# EasyEDA Pro project travellium-12v-desktop-power-supply-cc8d8467.epro, board MK9218_PCB
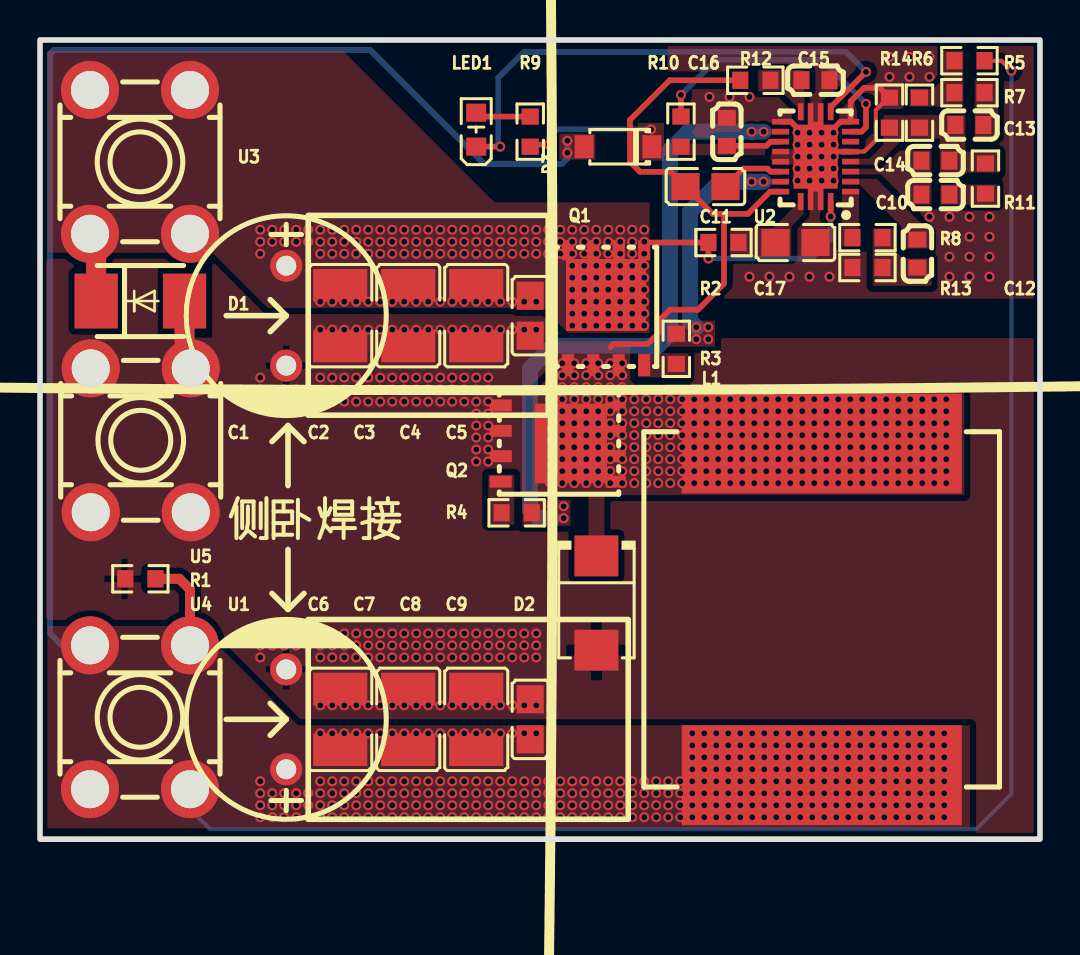
[diagram p9: board, top side]
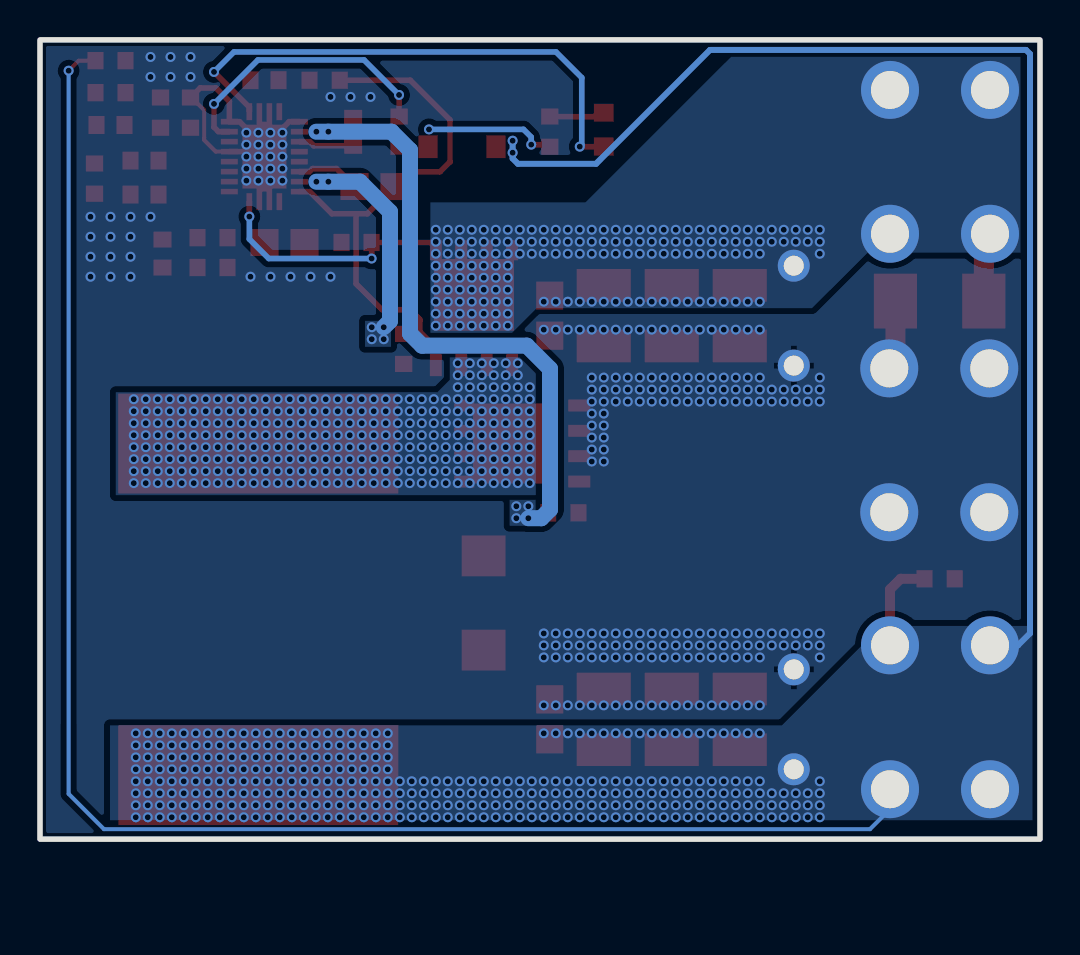
[diagram p10: board, bottom side, seen from below]

Outline 50 x 40 mm; copper layers: Top Layer, Bottom Layer. Coordinates in mm from the lower left corner of the outline.
Outline path: rectangle 50,0 0,40
Stack: Top Layer 0.035mm / Dielectric1 1.51mm FR4 er 4.5 / Bottom Layer 0.035mm

## Design rules (mm)
spacing copperThickness1oz (default): track to track 0.102, other pairs 0.152 to 0.3
spacing copperThickness2oz: track to track 0.203, other pairs 0.152 to 0.3
spacing Plane_innerPlane: track to track 0.102, other pairs 0.152 to 0.3
spacing Copper_copperRegion: track to track 0.102, other pairs 0.152 to 0.3
track width copperThickness1oz: min 0.127, default 0.254, max 2.54
track width copperThickness2oz: min 0.203, default 0.254, max 2.54
track width Travellium (default): min 0.099, default 0.201, max 10
differential pair differentialPair (default): width min 0.127, default 0.254, max 2.54; gap min 0.152, default 0.152
pour e1197 uses Copper_copperRegion
pour e1202 uses Copper_copperRegion
pour e1204 uses Copper_copperRegion
pour e1206 uses Copper_copperRegion

## Placement (name value [footprint] x y rotation side)
C1  100uF  [CAP-TH_BD10.0-P5.00-D0.6-FD_2]  12.31 26.2 270 top
C2  4.7uF  [C1210]  15.01 26.2 90 top
C3  4.7uF  [C1210]  18.41 26.2 90 top
C4  4.7uF  [C1210]  21.81 26.2 90 top
C5  100nF  [C0805]  24.51 26.2 90 top
C6  47uF  [C1210]  15.01 6 270 top
C7  47uF  [C1210]  18.41 6 270 top
C8  47uF  [C1210]  21.81 6 270 top
C9  100nF  [C0805]  24.51 6 270 top
C10  750pF  [C0603]  44.77 32.26 180 top
C11  100nF  [C0805]  33.27 32.66 0 top
C12  47nF  [C0603]  43.87 29.31 270 top
C13  390nF  [C0603]  46.47 35.74 180 top
C14  8.5pF  [C0603]  44.77 33.96 180 top
C15  10pF  [C0603]  38.77 37.99 180 top
C16  2.2uF  [C0603]  34.34 35.4 270 top
C17  100nF  [C0805]  37.77 29.86 0 top
D1  SMBJ64A  [SMB_L4.4-W3.6-LS5.3-L-FD]  5.02 26.93 180 top
D2  SMBJ15A  [SMB_L4.6-W3.6-LS5.3-RD]  27.82 11.82 270 top
D3  1N4148W  [SOD-123_L2.8-W1.8-LS3.7-RD]  28.9 34.66 180 top
L1  1.5uH  [IND-SMD_L17.5-W17.5]  39.08 11.5 270 top
LED1  NCD0603G1  [LED0603-RD_1]  21.81 35.51 90 top
Q1  BSC040N10NS5  [PG-TDSON-8_L5.9-W5.1-P1.27-LS6.1-BL]  28.3 26.6 0 top
Q2  BSC040N10NS5  [PG-TDSON-8_L5.9-W5.1-P1.27-LS6.1-BL]  25.91 19.8 270 top
R1  12kΩ  [R0603]  5.02 13.03 0 top
R2  2.2Ω  [R0603]  34.17 29.86 180 top
R3  0Ω  [R0603]  31.82 24.54 90 top
R4  0Ω  [R0603]  23.83 16.33 0 top
R5  51Ω  [R0603]  46.47 38.96 0 top
R6  51kΩ  [R0603]  43.97 36.36 90 top
R7  13kΩ  [R0603]  46.47 37.36 180 top
R8  12kΩ  [R0603]  41.37 30.1 180 top
R9  20kΩ  [R0603]  24.51 35.41 270 top
R10  20kΩ  [R0603]  32.05 35.41 270 top
R11  44.2kΩ  [R0603]  47.27 33.06 270 top
R12  390Ω  [R0603]  35.77 37.98 0 top
R13  0Ω  [R0603]  41.37 28.61 0 top
R14  3.6kΩ  [R0603]  42.47 36.36 270 top
U1  470uF  [CAP-TH_BD10.0-P5.00-D0.6-FD]  12.31 6 90 top
U2  MK9218  [VQFN-20_L4.5-W3.5-P0.50-BL-EP_TI_RHL0020A]  38.78 34.16 90 top
U3  T44001  [CONN-TH_T44001]  5 33.9 180 top
U4  T44001  [CONN-TH_T44001]  5 6.1 180 top
U5  T44001  [CONN-TH_T44001]  5.04 19.96 0 top

## Footprints (pads in the part's own frame, mm; a bottom-side part is the same pattern mirrored in y, then rotated)
C0603
  rect 0.8x0.9 smd: 1(-0.7,0) 2(0.7,0)
C0805
  rect 1.41x1.35 smd: 1(-1,0) 2(1,0)
C1210
  rect 1.635x2.7 smd: 1(-1.518,0) 2(1.518,0)
CAP-TH_BD10.0-P5.00-D0.6-FD
  round 1.6 hole 1: 1(-2.5,0) 2(2.5,0)
CAP-TH_BD10.0-P5.00-D0.6-FD_2
  round 1.6 hole 1: 1(-2.5,0) 2(2.5,0)
CONN-TH_T44001
  round 2.9 hole 1.9: 1(-2.5,3.6) 2(-2.5,-3.6) 3(2.5,-3.6) 4(2.5,3.6)
IND-SMD_L17.5-W17.5
  rect 5x14 smd: 1(-8.3,0) 2(8.3,0)
LED0603-RD_1
  rect 0.9x1 smd: 1(-0.85,0) 2(0.85,0)
PG-TDSON-8_L5.9-W5.1-P1.27-LS6.1-BL
  rect 0.6x1.1 smd: 1(-1.905,-2.875) 2(-0.635,-2.875) 3(0.635,-2.875) 4(1.905,-2.875)
  rect 0.6x1 smd: 5(1.905,2.875) 6(0.635,2.875) 7(-0.635,2.875) 8(-1.905,2.875)
  rect 4x3.6 smd: 8(0,0.638)
R0603
  rect 0.806x0.864 smd: 1(-0.753,0) 2(0.753,0)
SMB_L4.4-W3.6-LS5.3-L-FD
  rect 2.159x2.743 smd: 1(-2.21,0) 2(2.21,0)
SMB_L4.6-W3.6-LS5.3-RD
  rect 2.047x2.192 smd: 1(-2.361,0) 2(2.361,0)
SOD-123_L2.8-W1.8-LS3.7-RD
  rect 0.95x1.15 smd: 1(-1.692,0) 2(1.692,0)
VQFN-20_L4.5-W3.5-P0.50-BL-EP_TI_RHL0020A
  rect 0.85x0.28 smd: 1(-2.25,-0.752) 10(2.25,-0.752) 20(-2.25,0.75)
  rect 0.28x0.85 smd: 2(-1.748,-1.75) 3(-1.248,-1.75) 4(-0.749,-1.75) 5(-0.248,-1.75) 6(0.252,-1.75) 7(0.751,-1.75) 8(1.252,-1.75) 9(1.752,-1.75) 12(1.752,1.75) 13(1.252,1.75) 14(0.75,1.748) 15(0.25,1.748) 16(-0.25,1.748) 17(-0.75,1.748) 18(-1.25,1.748) 19(-1.75,1.748)
  custom 0.85x0.28 smd: 11(2.25,0.748)
  custom 5.35x2.2 smd: 21(0,0)

## Nets
As in the schematic.

Pads without a net: U2 7

## Via types
v1: diameter 0.5, hole 0.3, Top Layer to Bottom Layer, 993 vias
v2: diameter 0.5, hole 0.299, Top Layer to Bottom Layer, 31 vias

## Routing (per net, layer and track width the routed paths; a pad name or vN(x,y) marks a point on that pad's centre or on a via; arc(x,y) is an arc through that point)
GND: length 14.8
  Top Layer w0.2: R14.1 42.41,37.11 41.79,36.49 41.79,35.1 41.8,35.09 41.8,35 41.21,34.41 U2.6
  Top Layer w0.28: v1(39.68,35.36) 39.68,35.57 40.02,35.91 U2.9 40.53,36.93 41.2,37.6 41.99,37.6 R14.1 ; U2.6 39.33,34.41 v1(39.08,34.16) ; v1(37.88,35.36) 37.88,35.57 37.54,35.91 U2.12
  Top Layer w1: D1.1 7.23,23.87 U5.4
  vias: v1(11.01,23.1) v1(11.01,22.5) v1(11.01,21.9) v1(11.01,10.3) v1(11.01,9.7) v1(11.01,9.1) v1(11.61,22.5) v1(11.61,21.9) v1(11.61,10.3) v1(11.61,9.7) v1(12.21,22.5) v1(12.21,21.9) v1(12.21,10.3) v1(12.21,9.7) v1(12.81,22.5) v1(12.81,21.9) v1(12.81,10.3) v1(12.81,9.7) v1(13.41,22.5) v1(13.41,21.9) v1(13.41,10.3) v1(13.41,9.7) v1(14.01,25.5) v1(14.01,23.1) v1(14.01,22.5) v1(14.01,21.9) v1(14.01,10.3) v1(14.01,9.7) v1(14.01,9.1) v1(14.01,6.7) v1(14.61,25.5) v1(14.61,23.1) v1(14.61,22.5) v1(14.61,21.9) v1(14.61,10.3) v1(14.61,9.7) v1(14.61,9.1) v1(14.61,6.7) v1(15.21,25.5) v1(15.21,23.1) v1(15.21,22.5) v1(15.21,21.9) v1(15.21,10.3) v1(15.21,9.7) v1(15.21,9.1) v1(15.21,6.7) v1(15.81,25.5) v1(15.81,23.1) v1(15.81,22.5) v1(15.81,21.9) v1(15.81,10.3) v1(15.81,9.7) v1(15.81,9.1) v1(15.81,6.7) v1(16.41,25.5) v1(16.41,23.1) v1(16.41,22.5) v1(16.41,21.9) v1(16.41,10.3) v1(16.41,9.7) v1(16.41,9.1) v1(16.41,6.7) v1(17.01,25.5) v1(17.01,23.1) v1(17.01,22.5) v1(17.01,21.9) v1(17.01,10.3) v1(17.01,9.7) v1(17.01,9.1) v1(17.01,6.7) v1(17.61,25.5) v1(17.61,23.1) v1(17.61,22.5) v1(17.61,21.9) v1(17.61,10.3) v1(17.61,9.7) v1(17.61,9.1) v1(17.61,6.7) v1(18.21,25.5) v1(18.21,23.1) v1(18.21,22.5) v1(18.21,21.9) v1(18.21,10.3) v1(18.21,9.7) v1(18.21,9.1) v1(18.21,6.7) v1(18.81,25.5) v1(18.81,23.1) v1(18.81,22.5) v1(18.81,21.9) v1(18.81,10.3) v1(18.81,9.7) v1(18.81,9.1) v1(18.81,6.7) v1(19.41,25.5) v1(19.41,23.1) v1(19.41,22.5) v1(19.41,21.9) v1(19.41,10.3) v1(19.41,9.7) v1(19.41,9.1) v1(19.41,6.7) v1(20.01,25.5) v1(20.01,23.1) v1(20.01,22.5) v1(20.01,21.9) v1(20.01,10.3) v1(20.01,9.7) v1(20.01,9.1) v1(20.01,6.7) v1(20.61,25.5) v1(20.61,23.1) v1(20.61,22.5) v1(20.61,21.9) v1(20.61,10.3) v1(20.61,9.7) v1(20.61,9.1) v1(20.61,6.7) v1(21.21,25.5) v1(21.21,23.1) v1(21.21,22.5) v1(21.21,21.9) v1(21.21,10.3) v1(21.21,9.7) v1(21.21,9.1) v1(21.21,6.7) v1(21.81,25.5) v1(21.81,23.1) v1(21.81,22.5) v1(21.81,21.9) v1(21.81,21.3) v1(21.81,20.7) v1(21.81,20.1) v1(21.81,19.5) v1(21.81,18.9) v1(21.81,10.3) v1(21.81,9.7) v1(21.81,9.1) v1(21.81,6.7) v1(22.41,25.5) v1(22.41,23.1) v1(22.41,22.5) v1(22.41,21.9) v1(22.41,21.3) v1(22.41,20.7) v1(22.41,20.1) v1(22.41,19.5) v1(22.41,18.9) v1(22.41,10.3) v1(22.41,9.7) v1(22.41,9.1) v1(22.41,6.7) v1(23.01,25.5) v1(23.01,10.3) v1(23.01,9.7) v1(23.01,9.1) v1(23.01,6.7) v1(23.61,25.5) v1(23.61,10.3) v1(23.61,9.7) v1(23.61,9.1) v1(23.61,6.7) v1(24.21,25.5) v1(24.21,10.3) v1(24.21,9.7) v1(24.21,9.1) v1(24.21,6.7) v1(24.81,25.5) v1(24.81,10.3) v1(24.81,9.7) v1(24.81,9.1) v1(24.81,6.7) v1(37.88,34.76) v1(37.88,34.16) v1(37.88,33.56) v1(37.88,32.96) v1(38.48,35.36) v1(38.48,34.76) v1(38.48,34.16) v1(38.48,33.56) v1(38.48,32.96) v1(39.08,35.36) v1(39.08,34.76) v1(39.08,33.56) v1(39.08,32.96) v1(39.68,34.76) v1(39.68,34.16) v1(39.68,33.56) v1(39.68,32.96) v2(33.47,37.15) v2(34.47,37.15) v2(35.47,37.15) v2(35.47,28.15) v2(36.47,28.15) v2(37.47,28.15) v2(38.47,28.15) v2(39.47,28.15) v2(42.47,39.15) v2(42.47,38.15) v2(43.47,39.15) v2(43.47,38.15) v2(44.47,39.15) v2(44.47,38.15) v2(44.47,31.15) v2(45.47,31.15) v2(45.47,30.15) v2(45.47,29.15) v2(45.47,28.15) v2(46.47,31.15) v2(46.47,30.15) v2(46.47,29.15) v2(46.47,28.15) v2(47.47,31.15) v2(47.47,30.15) v2(47.47,29.15) v2(47.47,28.15)
P12V: length 146
  Top Layer w0.2: v1(48.57,38.46) 48.07,38.96 47.23,38.96
  Top Layer w0.5: R1.2 6.97,13.03 7.5,12.5 U4.2
  Bottom Layer w0.2: 7,2 8.5,0.5 46.8,0.5 48.57,2.27 v1(48.57,38.46)
  Bottom Layer w0.3: U4.3 1.1,9.7 0.5,10.3 0.5,39.3 0.7,39.5 16.5,39.5 22.2,33.8 26.1,33.8 26.37,34.07 v1(26.37,34.36) v1(26.37,34.96)
  vias: v1(11.01,2.9) v1(11.01,2.3) v1(11.01,1.7) v1(11.01,1.1) v1(11.61,2.3) v1(11.61,1.7) v1(11.61,1.1) v1(12.21,2.3) v1(12.21,1.7) v1(12.21,1.1) v1(12.81,2.3) v1(12.81,1.7) v1(12.81,1.1) v1(13.41,2.3) v1(13.41,1.7) v1(13.41,1.1) v1(14.01,5.3) v1(14.01,2.9) v1(14.01,2.3) v1(14.01,1.7) v1(14.01,1.1) v1(14.61,5.3) v1(14.61,2.9) v1(14.61,2.3) v1(14.61,1.7) v1(14.61,1.1) v1(15.21,5.3) v1(15.21,2.9) v1(15.21,2.3) v1(15.21,1.7) v1(15.21,1.1) v1(15.81,5.3) v1(15.81,2.9) v1(15.81,2.3) v1(15.81,1.7) v1(15.81,1.1) v1(16.41,5.3) v1(16.41,2.9) v1(16.41,2.3) v1(16.41,1.7) v1(16.41,1.1) v1(17.01,5.3) v1(17.01,2.9) v1(17.01,2.3) v1(17.01,1.7) v1(17.01,1.1) v1(17.61,5.3) v1(17.61,2.9) v1(17.61,2.3) v1(17.61,1.7) v1(17.61,1.1) v1(18.21,5.3) v1(18.21,2.9) v1(18.21,2.3) v1(18.21,1.7) v1(18.21,1.1) v1(18.81,5.3) v1(18.81,2.9) v1(18.81,2.3) v1(18.81,1.7) v1(18.81,1.1) v1(19.41,5.3) v1(19.41,2.9) v1(19.41,2.3) v1(19.41,1.7) v1(19.41,1.1) v1(20.01,5.3) v1(20.01,2.9) v1(20.01,2.3) v1(20.01,1.7) v1(20.01,1.1) v1(20.61,5.3) v1(20.61,2.9) v1(20.61,2.3) v1(20.61,1.7) v1(20.61,1.1) v1(21.21,5.3) v1(21.21,2.9) v1(21.21,2.3) v1(21.21,1.7) v1(21.21,1.1) v1(21.81,5.3) v1(21.81,2.9) v1(21.81,2.3) v1(21.81,1.7) v1(21.81,1.1) v1(22.41,5.3) v1(22.41,2.9) v1(22.41,2.3) v1(22.41,1.7) v1(22.41,1.1) v1(23.01,5.3) v1(23.01,2.9) v1(23.01,2.3) v1(23.01,1.7) v1(23.01,1.1) v1(23.61,5.3) v1(23.61,2.9) v1(23.61,2.3) v1(23.61,1.7) v1(23.61,1.1) v1(24.21,5.3) v1(24.21,2.9) v1(24.21,2.3) v1(24.21,1.7) v1(24.21,1.1) v1(24.81,5.3) v1(24.81,2.9) v1(24.81,2.3) v1(24.81,1.7) v1(24.81,1.1) v1(25.41,2.9) v1(25.41,2.3) v1(25.41,1.7) v1(25.41,1.1) v1(26.01,2.9) v1(26.01,2.3) v1(26.01,1.7) v1(26.01,1.1) v1(26.61,2.9) v1(26.61,2.3) v1(26.61,1.7) v1(26.61,1.1) v1(27.21,2.9) v1(27.21,2.3) v1(27.21,1.7) v1(27.21,1.1) v1(27.81,2.9) v1(27.81,2.3) v1(27.81,1.7) v1(27.81,1.1) v1(28.41,2.9) v1(28.41,2.3) v1(28.41,1.7) v1(28.41,1.1) v1(29.01,2.9) v1(29.01,2.3) v1(29.01,1.7) v1(29.01,1.1) v1(29.61,2.9) v1(29.61,2.3) v1(29.61,1.7) v1(29.61,1.1) v1(30.21,2.9) v1(30.21,2.3) v1(30.21,1.7) v1(30.21,1.1) v1(30.81,2.9) v1(30.81,2.3) v1(30.81,1.7) v1(30.81,1.1) v1(31.41,2.9) v1(31.41,2.3) v1(31.41,1.7) v1(31.41,1.1) v1(32.01,2.9) v1(32.01,2.3) v1(32.01,1.7) v1(32.01,1.1) v1(32.61,5.3) v1(32.61,4.7) v1(32.61,4.1) v1(32.61,3.5) v1(32.61,2.9) v1(32.61,2.3) v1(32.61,1.7) v1(32.61,1.1) v1(33.21,5.3) v1(33.21,4.7) v1(33.21,4.1) v1(33.21,3.5) v1(33.21,2.9) v1(33.21,2.3) v1(33.21,1.7) v1(33.21,1.1) v1(33.81,5.3) v1(33.81,4.7) v1(33.81,4.1) v1(33.81,3.5) v1(33.81,2.9) v1(33.81,2.3) v1(33.81,1.7) v1(33.81,1.1) v1(34.41,5.3) v1(34.41,4.7) v1(34.41,4.1) v1(34.41,3.5) v1(34.41,2.9) v1(34.41,2.3) v1(34.41,1.7) v1(34.41,1.1) v1(35.01,5.3) v1(35.01,4.7) v1(35.01,4.1) v1(35.01,3.5) v1(35.01,2.9) v1(35.01,2.3) v1(35.01,1.7) v1(35.01,1.1) v1(35.61,5.3) v1(35.61,4.7) v1(35.61,4.1) v1(35.61,3.5) v1(35.61,2.9) v1(35.61,2.3) v1(35.61,1.7) v1(35.61,1.1) v1(36.21,5.3) v1(36.21,4.7) v1(36.21,4.1) v1(36.21,3.5) v1(36.21,2.9) v1(36.21,2.3) v1(36.21,1.7) v1(36.21,1.1) v1(36.81,5.3) v1(36.81,4.7) v1(36.81,4.1) v1(36.81,3.5) v1(36.81,2.9) v1(36.81,2.3) v1(36.81,1.7) v1(36.81,1.1) v1(37.41,5.3) v1(37.41,4.7) v1(37.41,4.1) v1(37.41,3.5) v1(37.41,2.9) v1(37.41,2.3) v1(37.41,1.7) v1(37.41,1.1) v1(38.01,5.3) v1(38.01,4.7) v1(38.01,4.1) v1(38.01,3.5) v1(38.01,2.9) v1(38.01,2.3) v1(38.01,1.7) v1(38.01,1.1) v1(38.61,5.3) v1(38.61,4.7) v1(38.61,4.1) v1(38.61,3.5) v1(38.61,2.9) v1(38.61,2.3) v1(38.61,1.7) v1(38.61,1.1) v1(39.21,5.3) v1(39.21,4.7) v1(39.21,4.1) v1(39.21,3.5) v1(39.21,2.9) v1(39.21,2.3) v1(39.21,1.7) v1(39.21,1.1) v1(39.81,5.3) v1(39.81,4.7) v1(39.81,4.1) v1(39.81,3.5) v1(39.81,2.9) v1(39.81,2.3) v1(39.81,1.7) v1(39.81,1.1) v1(40.41,5.3) v1(40.41,4.7) v1(40.41,4.1) v1(40.41,3.5) v1(40.41,2.9) v1(40.41,2.3) v1(40.41,1.7) v1(40.41,1.1) v1(41.01,5.3) v1(41.01,4.7) v1(41.01,4.1) v1(41.01,3.5) v1(41.01,2.9) v1(41.01,2.3) v1(41.01,1.7) v1(41.01,1.1) v1(41.61,5.3) v1(41.61,4.7) v1(41.61,4.1) v1(41.61,3.5) v1(41.61,2.9) v1(41.61,2.3) v1(41.61,1.7) v1(41.61,1.1) v1(42.21,5.3) v1(42.21,4.7) v1(42.21,4.1) v1(42.21,3.5) v1(42.21,2.9) v1(42.21,2.3) v1(42.21,1.7) v1(42.21,1.1) v1(42.81,5.3) v1(42.81,4.7) v1(42.81,4.1) v1(42.81,3.5) v1(42.81,2.9) v1(42.81,2.3) v1(42.81,1.7) v1(42.81,1.1) v1(43.41,5.3) v1(43.41,4.7) v1(43.41,4.1) v1(43.41,3.5) v1(43.41,2.9) v1(43.41,2.3) v1(43.41,1.7) v1(43.41,1.1) v1(44.01,5.3) v1(44.01,4.7) v1(44.01,4.1) v1(44.01,3.5) v1(44.01,2.9) v1(44.01,2.3) v1(44.01,1.7) v1(44.01,1.1) v1(44.61,5.3) v1(44.61,4.7) v1(44.61,4.1) v1(44.61,3.5) v1(44.61,2.9) v1(44.61,2.3) v1(44.61,1.7) v1(44.61,1.1) v1(45.21,5.3) v1(45.21,4.7) v1(45.21,4.1) v1(45.21,3.5) v1(45.21,2.9) v1(45.21,2.3) v1(45.21,1.7) v1(45.21,1.1)
P60V: length 15.9
  Top Layer w0.28: v2(33.42,29.06) R2.2 30.25,29.86 v1(30.21,29.9) ; U2.1 v1(39.53,31.16)
  Top Layer w1: D1.2 2.81,29.99 U3.4
  Bottom Layer w0.28: v1(39.53,31.16) 39.53,30.03 38.56,29.06 v2(33.42,29.06)
  vias: v1(11.01,30.5) v1(11.01,29.9) v1(11.01,29.3) v1(11.61,30.5) v1(11.61,29.9) v1(12.21,30.5) v1(12.21,29.9) v1(12.81,30.5) v1(12.81,29.9) v1(13.41,30.5) v1(13.41,29.9) v1(14.01,30.5) v1(14.01,29.9) v1(14.01,29.3) v1(14.01,26.9) v1(14.61,30.5) v1(14.61,29.9) v1(14.61,29.3) v1(14.61,26.9) v1(15.21,30.5) v1(15.21,29.9) v1(15.21,29.3) v1(15.21,26.9) v1(15.81,30.5) v1(15.81,29.9) v1(15.81,29.3) v1(15.81,26.9) v1(16.41,30.5) v1(16.41,29.9) v1(16.41,29.3) v1(16.41,26.9) v1(17.01,30.5) v1(17.01,29.9) v1(17.01,29.3) v1(17.01,26.9) v1(17.61,30.5) v1(17.61,29.9) v1(17.61,29.3) v1(17.61,26.9) v1(18.21,30.5) v1(18.21,29.9) v1(18.21,29.3) v1(18.21,26.9) v1(18.81,30.5) v1(18.81,29.9) v1(18.81,29.3) v1(18.81,26.9) v1(19.41,30.5) v1(19.41,29.9) v1(19.41,29.3) v1(19.41,26.9) v1(20.01,30.5) v1(20.01,29.9) v1(20.01,29.3) v1(20.01,26.9) v1(20.61,30.5) v1(20.61,29.9) v1(20.61,29.3) v1(20.61,26.9) v1(21.21,30.5) v1(21.21,29.9) v1(21.21,29.3) v1(21.21,26.9) v1(21.81,30.5) v1(21.81,29.9) v1(21.81,29.3) v1(21.81,26.9) v1(22.41,30.5) v1(22.41,29.9) v1(22.41,29.3) v1(22.41,26.9) v1(23.01,30.5) v1(23.01,29.9) v1(23.01,29.3) v1(23.01,26.9) v1(23.61,30.5) v1(23.61,29.9) v1(23.61,29.3) v1(23.61,26.9) v1(24.21,30.5) v1(24.21,29.9) v1(24.21,29.3) v1(24.21,26.9) v1(24.81,30.5) v1(24.81,29.9) v1(24.81,29.3) v1(24.81,26.9) v1(25.41,30.5) v1(25.41,29.9) v1(25.41,29.3) v1(26.01,30.5) v1(26.01,29.9) v1(26.01,29.3) v1(26.61,30.5) v1(26.61,29.9) v1(26.61,29.3) v1(26.61,28.7) v1(26.61,28.1) v1(26.61,27.5) v1(26.61,26.9) v1(26.61,26.3) v1(26.61,25.7) v1(27.21,30.5) v1(27.21,29.9) v1(27.21,29.3) v1(27.21,28.7) v1(27.21,28.1) v1(27.21,27.5) v1(27.21,26.9) v1(27.21,26.3) v1(27.21,25.7) v1(27.81,30.5) v1(27.81,29.9) v1(27.81,29.3) v1(27.81,28.7) v1(27.81,28.1) v1(27.81,27.5) v1(27.81,26.9) v1(27.81,26.3) v1(27.81,25.7) v1(28.41,30.5) v1(28.41,29.9) v1(28.41,29.3) v1(28.41,28.7) v1(28.41,28.1) v1(28.41,27.5) v1(28.41,26.9) v1(28.41,26.3) v1(28.41,25.7) v1(29.01,30.5) v1(29.01,29.9) v1(29.01,29.3) v1(29.01,28.7) v1(29.01,28.1) v1(29.01,27.5) v1(29.01,26.9) v1(29.01,26.3) v1(29.01,25.7) v1(29.61,30.5) v1(29.61,29.9) v1(29.61,29.3) v1(29.61,28.7) v1(29.61,28.1) v1(29.61,27.5) v1(29.61,26.9) v1(29.61,26.3) v1(29.61,25.7) v1(30.21,30.5) v1(30.21,29.3) v1(30.21,28.7) v1(30.21,28.1) v1(30.21,27.5) v1(30.21,26.9) v1(30.21,26.3) v1(30.21,25.7)
SW: length 28.4
  Top Layer w0.28: 34.2,31.3 34.2,27.8 32.9,26.5 31.5,26.5 31.24,26.24 31.23,26.24 31.06,26.06 31.06,26.06 31,26 31,25.4 30.38,24.78 28.67,24.78 28.51,24.62 ; 34.2,31.3 33.63,31.3 C11.1 31.53,33.4 30,33.4 29.5,33.9 29.5,36 31.48,37.98 R12.1 ; 34.2,31.3 35.4,31.3 36.51,32.41 U2.19
  vias: v1(25.51,22.62) v1(25.51,22.02) v1(25.51,21.42) v1(25.51,20.82) v1(25.51,20.22) v1(25.51,19.62) v1(25.51,19.02) v1(25.51,18.42) v1(25.51,17.82) v1(26.11,23.82) v1(26.11,23.22) v1(26.11,22.62) v1(26.11,22.02) v1(26.11,21.42) v1(26.11,20.82) v1(26.11,20.22) v1(26.11,19.62) v1(26.11,19.02) v1(26.11,18.42) v1(26.11,17.82) v1(26.71,23.82) v1(26.71,23.22) v1(26.71,22.62) v1(26.71,22.02) v1(26.71,21.42) v1(26.71,20.82) v1(26.71,20.22) v1(26.71,19.62) v1(26.71,19.02) v1(26.71,18.42) v1(26.71,17.82) v1(27.31,23.82) v1(27.31,23.22) v1(27.31,22.62) v1(27.31,22.02) v1(27.31,21.42) v1(27.31,20.82) v1(27.31,20.22) v1(27.31,19.62) v1(27.31,19.02) v1(27.31,18.42) v1(27.31,17.82) v1(27.91,23.82) v1(27.91,23.22) v1(27.91,22.62) v1(27.91,22.02) v1(27.91,21.42) v1(27.91,20.82) v1(27.91,20.22) v1(27.91,19.62) v1(27.91,19.02) v1(27.91,18.42) v1(27.91,17.82) v1(28.51,23.82) v1(28.51,23.22) v1(28.51,22.62) v1(28.51,22.02) v1(28.51,21.42) v1(28.51,20.82) v1(28.51,20.22) v1(28.51,19.62) v1(28.51,19.02) v1(28.51,18.42) v1(28.51,17.82) v1(29.11,23.82) v1(29.11,23.22) v1(29.11,22.62) v1(29.11,22.02) v1(29.11,21.42) v1(29.11,20.82) v1(29.11,20.22) v1(29.11,19.62) v1(29.11,19.02) v1(29.11,18.42) v1(29.11,17.82) v1(29.71,22.02) v1(29.71,21.42) v1(29.71,20.82) v1(29.71,20.22) v1(29.71,19.62) v1(29.71,19.02) v1(29.71,18.42) v1(29.71,17.82) v1(30.31,22.02) v1(30.31,21.42) v1(30.31,20.82) v1(30.31,20.22) v1(30.31,19.62) v1(30.31,19.02) v1(30.31,18.42) v1(30.31,17.82) v1(30.91,22.02) v1(30.91,21.42) v1(30.91,20.82) v1(30.91,20.22) v1(30.91,19.62) v1(30.91,19.02) v1(30.91,18.42) v1(30.91,17.82) v1(31.51,22.02) v1(31.51,21.42) v1(31.51,20.82) v1(31.51,20.22) v1(31.51,19.62) v1(31.51,19.02) v1(31.51,18.42) v1(31.51,17.82) v1(32.11,22.02) v1(32.11,21.42) v1(32.11,20.82) v1(32.11,20.22) v1(32.11,19.62) v1(32.11,19.02) v1(32.11,18.42) v1(32.11,17.82) v1(32.71,22.02) v1(32.71,21.42) v1(32.71,20.82) v1(32.71,20.22) v1(32.71,19.62) v1(32.71,19.02) v1(32.71,18.42) v1(32.71,17.82) v1(33.31,22.02) v1(33.31,21.42) v1(33.31,20.82) v1(33.31,20.22) v1(33.31,19.62) v1(33.31,19.02) v1(33.31,18.42) v1(33.31,17.82) v1(33.91,22.02) v1(33.91,21.42) v1(33.91,20.82) v1(33.91,20.22) v1(33.91,19.62) v1(33.91,19.02) v1(33.91,18.42) v1(33.91,17.82) v1(34.51,22.02) v1(34.51,21.42) v1(34.51,20.82) v1(34.51,20.22) v1(34.51,19.62) v1(34.51,19.02) v1(34.51,18.42) v1(34.51,17.82) v1(35.11,22.02) v1(35.11,21.42) v1(35.11,20.82) v1(35.11,20.22) v1(35.11,19.62) v1(35.11,19.02) v1(35.11,18.42) v1(35.11,17.82) v1(35.71,22.02) v1(35.71,21.42) v1(35.71,20.82) v1(35.71,20.22) v1(35.71,19.62) v1(35.71,19.02) v1(35.71,18.42) v1(35.71,17.82) v1(36.31,22.02) v1(36.31,21.42) v1(36.31,20.82) v1(36.31,20.22) v1(36.31,19.62) v1(36.31,19.02) v1(36.31,18.42) v1(36.31,17.82) v1(36.91,22.02) v1(36.91,21.42) v1(36.91,20.82) v1(36.91,20.22) v1(36.91,19.62) v1(36.91,19.02) v1(36.91,18.42) v1(36.91,17.82) v1(37.51,22.02) v1(37.51,21.42) v1(37.51,20.82) v1(37.51,20.22) v1(37.51,19.62) v1(37.51,19.02) v1(37.51,18.42) v1(37.51,17.82) v1(38.11,22.02) v1(38.11,21.42) v1(38.11,20.82) v1(38.11,20.22) v1(38.11,19.62) v1(38.11,19.02) v1(38.11,18.42) v1(38.11,17.82) v1(38.71,22.02) v1(38.71,21.42) v1(38.71,20.82) v1(38.71,20.22) v1(38.71,19.62) v1(38.71,19.02) v1(38.71,18.42) v1(38.71,17.82) v1(39.31,22.02) v1(39.31,21.42) v1(39.31,20.82) v1(39.31,20.22) v1(39.31,19.62) v1(39.31,19.02) v1(39.31,18.42) v1(39.31,17.82) v1(39.91,22.02) v1(39.91,21.42) v1(39.91,20.82) v1(39.91,20.22) v1(39.91,19.62) v1(39.91,19.02) v1(39.91,18.42) v1(39.91,17.82) v1(40.51,22.02) v1(40.51,21.42) v1(40.51,20.82) v1(40.51,20.22) v1(40.51,19.62) v1(40.51,19.02) v1(40.51,18.42) v1(40.51,17.82) v1(41.11,22.02) v1(41.11,21.42) v1(41.11,20.82) v1(41.11,20.22) v1(41.11,19.62) v1(41.11,19.02) v1(41.11,18.42) v1(41.11,17.82) v1(41.71,22.02) v1(41.71,21.42) v1(41.71,20.82) v1(41.71,20.22) v1(41.71,19.62) v1(41.71,19.02) v1(41.71,18.42) v1(41.71,17.82) v1(42.31,22.02) v1(42.31,21.42) v1(42.31,20.82) v1(42.31,20.22) v1(42.31,19.62) v1(42.31,19.02) v1(42.31,18.42) v1(42.31,17.82) v1(42.91,22.02) v1(42.91,21.42) v1(42.91,20.82) v1(42.91,20.22) v1(42.91,19.62) v1(42.91,19.02) v1(42.91,18.42) v1(42.91,17.82) v1(43.51,22.02) v1(43.51,21.42) v1(43.51,20.82) v1(43.51,20.22) v1(43.51,19.62) v1(43.51,19.02) v1(43.51,18.42) v1(43.51,17.82) v1(44.11,22.02) v1(44.11,21.42) v1(44.11,20.82) v1(44.11,20.22) v1(44.11,19.62) v1(44.11,19.02) v1(44.11,18.42) v1(44.11,17.82) v1(44.71,22.02) v1(44.71,21.42) v1(44.71,20.82) v1(44.71,20.22) v1(44.71,19.62) v1(44.71,19.02) v1(44.71,18.42) v1(44.71,17.82) v1(45.31,22.02) v1(45.31,21.42) v1(45.31,20.82) v1(45.31,20.22) v1(45.31,19.62) v1(45.31,19.02) v1(45.31,18.42) v1(45.31,17.82)
$1N32058: length 9.4
  Top Layer w0.28: R9.2 24.62,34.76 v2(25.44,34.76) ; C16.2 36.31,34.7 36.52,34.91 U2.14
  Bottom Layer w0.28: v1(30.55,35.52) 25.82,35.52 25.44,35.14 v2(25.44,34.76)
$1N32091: length 14
  Top Layer w0.28: v2(32.05,37.25) R10.1 ; U2.8 41.08,35.41 41.3,35.63 v1(41.3,36.8)
  Bottom Layer w0.28: v2(32.05,37.25) 33.8,39 39.1,39 v1(41.3,36.8)
$1N32186: length 2.8
  Top Layer w0.28: LED1.2 22.01,36.16 R9.1
$1N32326: length 30.3
  Bottom Layer w0.8: v1(36.18,35.41) v1(35.58,35.41) 32.42,35.41 31.5,34.49 31.5,25.3 30.9,24.7 25.66,24.7 24.5,23.54 24.5,16.5 24.94,16.06 v1(25.58,16.06)
  vias: v1(25.58,16.66) v1(26.18,16.66) v1(26.18,16.06)
$1N32622: length 3.2
  Top Layer w0.28: U2.17 36.53,33.41 36.37,33.56 35.17,33.56 C11.2
$1N32707: length 10.2
  Bottom Layer w0.8: v1(32.81,25.62) 32.5,25.94 32.5,31.4 34,32.91 v1(35.58,32.91) v1(36.18,32.91)
  vias: v1(32.81,25.02) v1(33.41,25.62) v1(33.41,25.02)
$1N34967: length 26.8
  Top Layer w0.28: v1(23.01,34.66) LED1.1 ; v2(41.3,38.4) 39.53,36.63 U2.10
  Bottom Layer w0.28: v2(41.3,38.4) 40.3,39.4 24.2,39.4 22.91,38.11 22.91,34.76 v1(23.01,34.66)

## Copper pours and planes (outline as drawn; the poured copper is in the pictures)
GND on Top Layer: 0,0 0,40 30.54,40 30.54,25.08 50,25.08 50,0
GND on Top Layer: 36.63,34.55 38.13,34.55 38.13,33.77 36.63,33.77
GND on Top Layer: 31.37,40 50,40 50,27.05 31.37,27.05
GND on Bottom Layer: -0.03,40 -0.03,11.15 7.45,11.15 12.9,5.7 50,5.7 50,40
GND on Bottom Layer: 0,40 50,40 50,0 0,0
P12V on Top Layer: 25.97,35.31 27.77,35.31 27.77,34.01 25.97,34.01
P12V on Top Layer: 0.37,10.67 46.5,10.67 46.5,0.55 0.37,0.55
P12V on Bottom Layer: 0.37,10.67 46.5,10.67 46.5,0.95 0.37,0.95
P60V on Top Layer: 0.37,39.45 30.48,39.45 30.48,25.34 0.37,25.34
P60V on Bottom Layer: 0.97,39.15 30.48,39.15 30.48,25.34 0.97,25.34
GH on Top Layer: 29.91,24.32 32.41,24.32 32.41,23.12 29.91,23.12
GL on Top Layer: 22.41,18.24 23.71,18.24 23.71,15.74 22.41,15.74
SW on Top Layer: 24.61,24.92 46.21,24.92 46.21,13.19 24.61,13.19
SW on Bottom Layer: 25.21,24.12 46.21,24.12 46.21,17.22 25.21,17.22
$1N5923 on Top Layer: 46.73,38.02 47.89,38.02 47.89,35.16 46.73,35.16
$1N5928 on Top Layer: 40.1,36.24 47.97,36.24 47.97,33.36 40.1,33.36
$1N6075 on Top Layer: 43.47,39.46 46.17,39.46 46.17,36.66 43.47,36.66
$1N31770 on Top Layer: 41.64,30.58 44.57,30.58 44.57,27.69 41.64,27.69
$1N31791 on Top Layer: 40.1,33.05 44.5,33.05 44.5,29.56 40.1,29.56
$1N31948 on Top Layer: 34.49,32.33 38.18,32.33 38.18,29.1 34.49,29.1
$1N32058 on Top Layer: 30.27,34.8 36.25,34.8 36.25,34.23 30.27,34.23
$1N32058 on Top Layer: 29.9,35.85 31.2,35.85 31.2,33.95 29.9,33.95
$1N32326 on Top Layer: 24.12,16.98 26.52,16.98 26.52,15.68 24.12,15.68
$1N32326 on Bottom Layer: 25.22,16.98 26.52,16.98 26.52,15.68 25.22,15.68
$1N32707 on Top Layer: 31.35,25.94 33.75,25.94 33.75,24.64 31.35,24.64
$1N32707 on Bottom Layer: 32.45,25.94 33.75,25.94 33.75,24.64 32.45,24.64
$1N32717 on Top Layer: 35.9,38.5 38.22,38.5 38.22,35.98 35.9,35.98
$1N37231 on Top Layer: 40.1,32.43 40.95,32.43 40.95,29.67 40.1,29.67
$1N38925 on Top Layer: 45.01,32.76 47.87,32.76 47.87,31.76 45.01,31.76
$1N38932 on Top Layer: 40.1,34.47 44.57,34.47 44.57,31.76 40.1,31.76

Small or netless copper shapes (teardrops, artwork), in the pictures only: 2 on Top Layer

## Text on the board
Top Silkscreen Layer: 侧卧焊接
